# Altium schematic sheet TYPE-C 16PIN 2MD(073).schdoc
size 127 x 101 mm
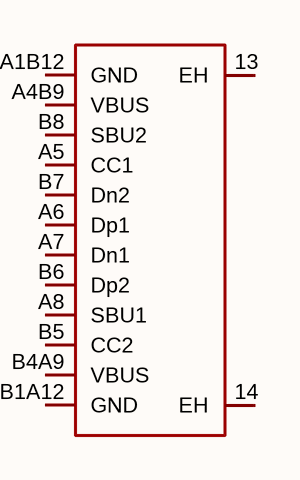
[diagram p0: TYPE-C 16PIN 2MD(073).schdoc]

## Parts
USB?  type-c 16pin 2md(073)  [USB-C-SMD_TYPE-C-16PIN-2MD-073]  (value not drawn)

## Nets

Not connected (* = marked no-connect by the designer): USB? 13(EH) 14(EH) A1B12(GND) A4B9(VBUS) A5(CC1) A6(Dp1) A7(Dn1) A8(SBU1) B1A12(GND) B4A9(VBUS) B5(CC2) B6(Dp2) B7(Dn2) B8(SBU2)

## Library data of the parts
USB? = type-c 16pin 2md(073): 连接器类型:Type-C;协议标准:-;公母:母;安装方式:卧贴;触点数量:16P;端口数量:1;额定电流 - 电源:3A;工作温度:-25℃~+85℃;; Manufacturer: SHOU HAN(首韩); AddInBom: yes; ModelId: 3a41b9ec9b654a0fad4d118405ec6290; ModelName: USB-C-SMD_TYPE-C-6PIN-2MD-073; ModelTransform: 351.9678,298.4246,0,0,0,0,0,-47.244,-35.433; Gender: 母; Number of Contacts: 16P; Number of Ports: 1; Current Rating-Power: 3A; Voltage Rating: 5V; Connect-Disconnect Life: 1万次; Detection color: 黑色; Symbol: TYPE-C 16PIN 2MD(073); LCSC Part Name: Type-C 母 卧贴; SupplierPart: C2765186; ManufacturerPart: TYPE-C 16PIN 2MD(073); Supplier Footprint: SMD; JLCPCB Part Class: Extended Part; Datasheet: https://item.szlcsc.com/datasheet/TYPE-C%252016PIN%25202MD(073)/2901843.html; Supplier: LCSC; ConvertToPcb: yes; FootprintName: USB-C-SMD_TYPE-C-16PIN-2MD-073; Connector Type: Type-C; Protocol Standard: -; Mounting Type: 卧贴; Supplementary Features: -; Center Height: -; Length: 7.35mm; Operating Temperature: -25℃~+85℃